# Altium project old.PrjPcb
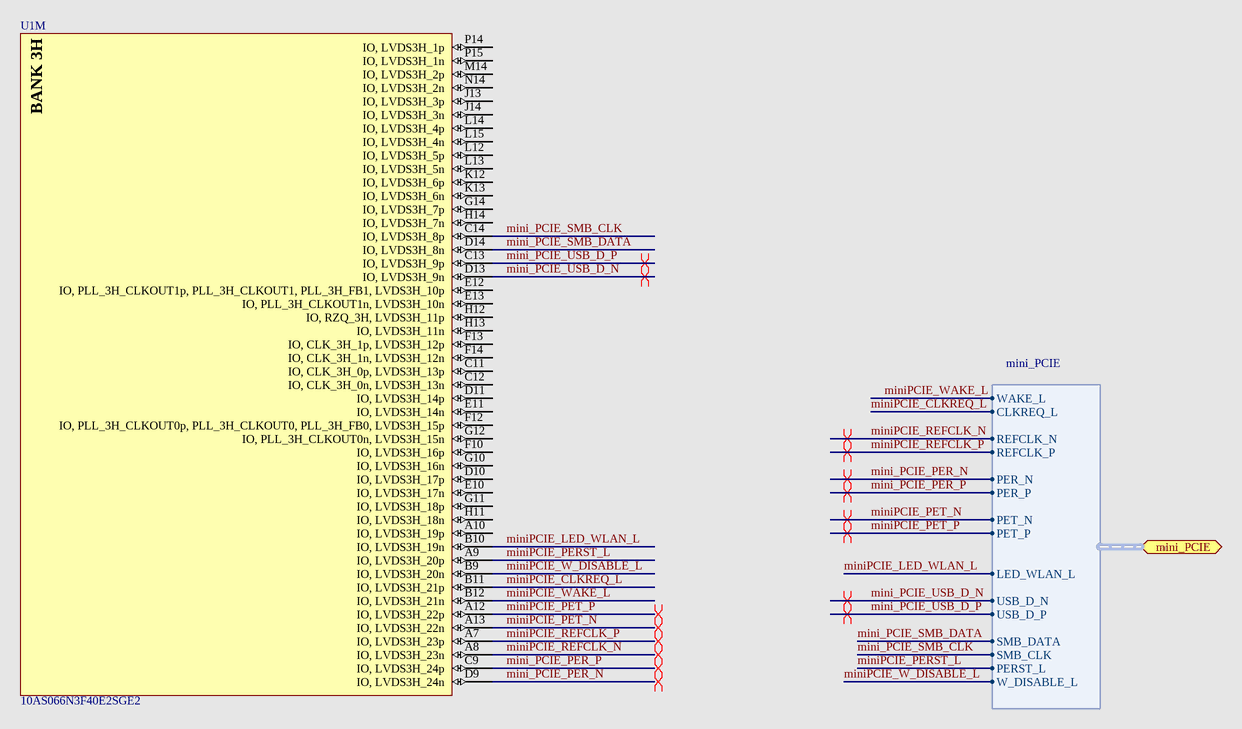
[diagram p0: old_Power.SchDoc]
5 sheets, 23 parts. Net scope: flat (ports and power ports of the same name join across sheets).
Sheets:
  old_Power.SchDoc
  old_Analog.SchDoc
  old_IO.SchDoc
  old_Debug.SchDoc
  old_Storage.SchDoc

## Sheet old_Power.SchDoc: miniPCIE Arria10
size B; DocumentNumber: 23; SheetNumber: 23; SheetTotal: 46

### Parts
(Parts that share a designator on the sheet are numbered #1, #2 ... from top to bottom, then left to right.)
U1#1  10AS066N3F40E2SGE2  [ALTR-FBGA1517_A-350]  (part M of 31)

### Ports
mini_PCIE (harness mini_PCIE)

### Harnesses
mini_PCIE: WAKE_L, CLKREQ_L, REFCLK_N, REFCLK_P, PER_N, PER_P, PET_N, PET_P, LED_WLAN_L, USB_D_N, USB_D_P, SMB_DATA, SMB_CLK, PERST_L, W_DISABLE_L

### Nets
mini_PCIE_PER_N: U1#1.D9(IO,_LVDS3H_24n) ; port mini_PCIE.PER_N
mini_PCIE_PER_P: U1#1.C9(IO,_LVDS3H_24p) ; port mini_PCIE.PER_P
mini_PCIE_SMB_CLK: U1#1.C14(IO,_LVDS3H_8p) ; port mini_PCIE.SMB_CLK
mini_PCIE_SMB_DATA: U1#1.D14(IO,_LVDS3H_8n) ; port mini_PCIE.SMB_DATA
mini_PCIE_USB_D_N: U1#1.D13(IO,_LVDS3H_9n) ; port mini_PCIE.USB_D_N
mini_PCIE_USB_D_P: U1#1.C13(IO,_LVDS3H_9p) ; port mini_PCIE.USB_D_P
miniPCIE_CLKREQ_L: U1#1.B11(IO,_LVDS3H_21p) ; port mini_PCIE.CLKREQ_L
miniPCIE_LED_WLAN_L: U1#1.B10(IO,_LVDS3H_19n) ; port mini_PCIE.LED_WLAN_L
miniPCIE_PERST_L: U1#1.A9(IO,_LVDS3H_20p) ; port mini_PCIE.PERST_L
miniPCIE_PET_N: U1#1.A13(IO,_LVDS3H_22n) ; port mini_PCIE.PET_N
miniPCIE_PET_P: U1#1.A12(IO,_LVDS3H_22p) ; port mini_PCIE.PET_P
miniPCIE_REFCLK_N: U1#1.A8(IO,_LVDS3H_23n) ; port mini_PCIE.REFCLK_N
miniPCIE_REFCLK_P: U1#1.A7(IO,_LVDS3H_23p) ; port mini_PCIE.REFCLK_P
miniPCIE_W_DISABLE_L: U1#1.B9(IO,_LVDS3H_20n) ; port mini_PCIE.W_DISABLE_L
miniPCIE_WAKE_L: U1#1.B12(IO,_LVDS3H_21n) ; port mini_PCIE.WAKE_L

Not connected (* = marked no-connect by the designer): U1#1 A10(IO,_LVDS3H_19p) C11(IO,_CLK_3H_0p,_LVDS3H_13p) C12(IO,_CLK_3H_0n,_LVDS3H_13n) D10(IO,_LVDS3H_17p) D11(IO,_LVDS3H_14p) E10(IO,_LVDS3H_17n) E11(IO,_LVDS3H_14n) E12(IO,_PLL_3H_CLKOUT1p,_PLL_3H_CLKOUT1,_PLL_3H_FB1,_LVDS3H_10p) E13(IO,_PLL_3H_CLKOUT1n,_LVDS3H_10n) F10(IO,_LVDS3H_16p) F12(IO,_PLL_3H_CLKOUT0p,_PLL_3H_CLKOUT0,_PLL_3H_FB0,_LVDS3H_15p) F13(IO,_CLK_3H_1p,_LVDS3H_12p) F14(IO,_CLK_3H_1n,_LVDS3H_12n) G10(IO,_LVDS3H_16n) G11(IO,_LVDS3H_18p) G12(IO,_PLL_3H_CLKOUT0n,_LVDS3H_15n) G14(IO,_LVDS3H_7p) H11(IO,_LVDS3H_18n) H12(IO,_RZQ_3H,_LVDS3H_11p) H13(IO,_LVDS3H_11n) H14(IO,_LVDS3H_7n) J13(IO,_LVDS3H_3p) J14(IO,_LVDS3H_3n) K12(IO,_LVDS3H_6p) K13(IO,_LVDS3H_6n) L12(IO,_LVDS3H_5p) L13(IO,_LVDS3H_5n) L14(IO,_LVDS3H_4p) L15(IO,_LVDS3H_4n) M14(IO,_LVDS3H_2p) N14(IO,_LVDS3H_2n) P14(IO,_LVDS3H_1p) P15(IO,_LVDS3H_1n)

### Layout directives
differential pair: mini_PCIE_PER_N, mini_PCIE_PER_P, mini_PCIE_USB_D_N, mini_PCIE_USB_D_P, miniPCIE_PET_N, miniPCIE_PET_P, miniPCIE_REFCLK_N, miniPCIE_REFCLK_P

### Notes on the sheet
- Title
- Size:
- Date:
- B
- Number:
- Time:
- Revision:
- Sheet
- of
- File:
- (in symbol CMP-1689-00006-3, part M) BANK 3H

### Library data of the parts
U1#1 = CMP-1689-00006-3: Arria 10 SX Family, 588 I/O Pins, 16 Fractional PLLs, 1517-Pin FBGA, Speed Grade 2, Extended Grade, RoHS; ComponentLink3Description: Package Specification; PackageVersion: Rev. 5.0, 01/2016; ComponentLink3URL: https://www.altera.com/content/dam/altera-www/global/en_US/pdfs/literature/packaging/04r00461-04.pdf; ComponentLink2Description: Datasheet; Code_JEDEC: MS-034; Mounting Technology: Surface Mount; PartNumber: 10AS066N3F40E2SGE2; PackageDescription: 1517-Pin FineLine Ball-Grid Array (FBGA), Body 40 x 40 mm, Pitch 1 mm; ComponentLink2URL: https://www.altera.com/content/dam/altera-www/global/en_US/pdfs/literature/hb/arria-10/a10_datasheet.pdf; ComponentLink1URL: https://www.altera.com/; DatasheetVersion: Rev. 2016-06-24, 06/2016; ComponentLink1Description: Manufacturer URL

## Sheet old_Analog.SchDoc
size A4; SheetNumber: 1; SheetTotal: 1; SPICEModelCacheCSPBSJPQ: <root> / <DocumentId>CSPBSJPQ</DocumentId> / <CacheFrame Number="0"> / <Model Name="bc846" Kind="MDL"> / <Text>.MODEL BC846 NPN(  BF=324.4 BR=8.29 CJC=3.347E-12 CJE=1.244E-11 FC=0.979 IKF=0.109 IKR=0.09 IRB=5E-06 IS=1.822E-14 ISC=9.982E-12 ISE=2.894E-16 ITF=0.3131 MJC=0.391 MJE=0.3656 MJS=0.333 NC=1.763 NE=1.4 NF=0.9932 NK=500M NR=0.9931 RB=10 RBM=5 RC=0.7014 RE=0.649 TF=4.908E-10 TR=9E-08 VAF=82 VAR=17.9 VJC=0.5463 VJE=0.7579 VTF=2.927 XCJC=0.6193 XTF=9.51 )</Text> / </Model> / </CacheFrame> / </root>
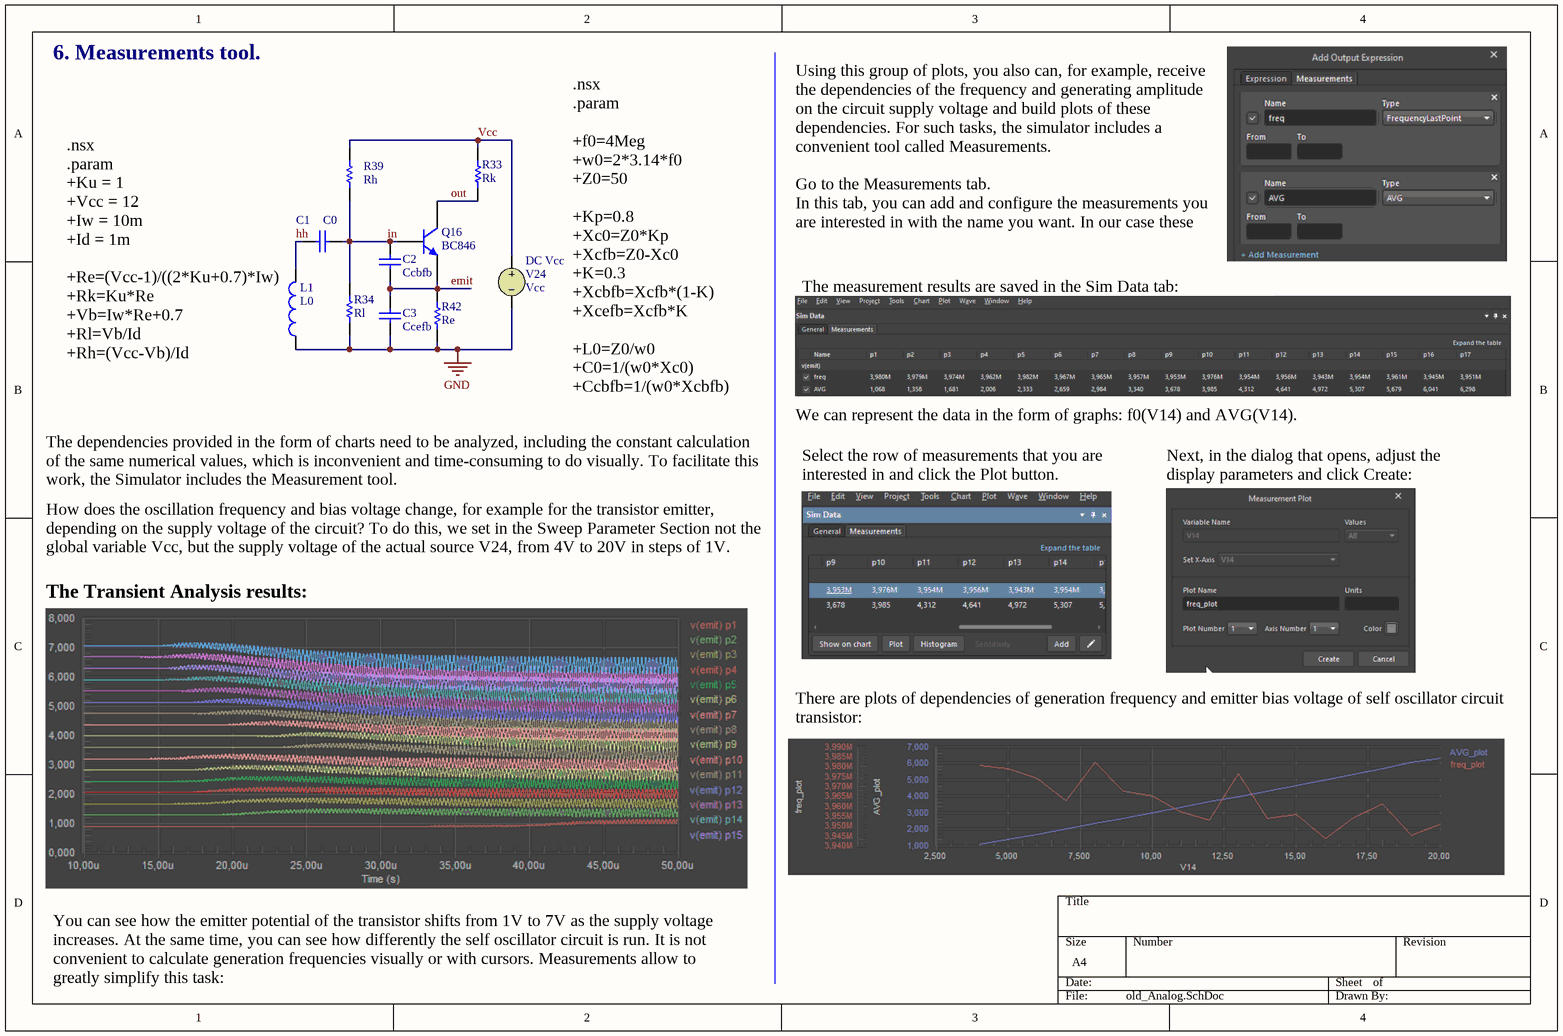
[diagram p1: old_Analog.SchDoc]

### Parts
C1  value C0  (hidden comment: Capacitor)
C2  value Ccbfb  (hidden comment: Capacitor)
C3  value Ccefb  (hidden comment: Capacitor)
L1  value L0  (hidden comment: Inductor)
Q16  BC846  [TO-92A]
R33  value Rk  (hidden comment: Resistor)
R34  value Rl  (hidden comment: Resistor)
R39  value Rh  (hidden comment: Resistor)
R42  value Re  (hidden comment: Resistor)
V24  DC Vcc  value Vcc

### Nets
GND: C3.1 L1.1 R34.2 R42.1 V24.2
emit: C2.1 C3.2 Q16.1(E) R42.2
hh: C1.1 L1.2
in: C1.2 C2.2 Q16.2(B) R34.1 R39.1
out: Q16.3(C) R33.1
Vcc: R33.2 R39.2 V24.1

### Notes on the sheet
- 6. Measurements tool.
- Using this group of plots, you also can, for example, receive the dependencies of the frequency and generating amplitude on the circuit supply voltage and build plots of these dependencies. For such tasks, the simulator includes a convenient tool called Measurements.
  Go to the Measurements tab.
  In this tab, you can add and configure the measurements you are interested in with the name you want. In our case these are: FrequenciLastPoint and AVG:
- The measurement results are saved in the Sim Data tab:
- (near L1) .nsx
  .param
  +Ku = 1
  +Vcc = 12
  +Iw = 10m
  +Id = 1m
  +Re=(Vcc-1)/((2*Ku+0.7)*Iw)
  +Rk=Ku*Re
  +Vb=Iw*Re+0.7
  +Rl=Vb/Id
  +Rh=(Vcc-Vb)/Id
- .nsx
  .param
  +f0=4Meg
  +w0=2*3.14*f0
  +Z0=50
  +Kp=0.8
  +Xc0=Z0*Kp
  +Xcfb=Z0-Xc0
  +K=0.3
  +Xcbfb=Xcfb*(1-K)
  +Xcefb=Xcfb*K
  +L0=Z0/w0
  +C0=1/(w0*Xc0)
  +Ccbfb=1/(w0*Xcbfb)
  +Ccefb=1/(w0*Xcefb)
- We can represent the data in the form of graphs: f0(V14) and AVG(V14).
- The dependencies provided in the form of charts need to be analyzed, including the constant calculation of the same numerical values, which is inconvenient and time-consuming to do visually. To facilitate this work, the Simulator includes the Measurement tool.
- Select the row of measurements that you are interested in and click the Plot button.
- Next, in the dialog that opens, adjust the display parameters and click Create:
- How does the oscillation frequency and bias voltage change, for example for the transistor emitter, depending on the supply voltage of the circuit? To do this, we set in the Sweep Parameter Section not the global variable Vcc, but the supply voltage of the actual source V24, from 4V to 20V in steps of 1V.
- The Transient Analysis results:
- There are plots of dependencies of generation frequency and emitter bias voltage of self oscillator circuit transistor:
- You can see how the emitter potential of the transistor shifts from 1V to 7V as the supply voltage increases. At the same time, you can see how differently the self oscillator circuit is run. It is not convenient to calculate generation frequencies visually or with cursors. Measurements allow to greatly simplify this task:

### Library data of the parts
C1-C3 = Capacitor: SimulationGenericComponent: True
L1 = Inductor: SimulationGenericComponent: True
Q16 = 2N3904: NPN General Purpose Amplifier; Published: 8-Jun-2000; LatestRevisionDate: 15-Jan-2003; LatestRevisionNote: PCB Footprint 'BCY-W3/D4.7' replaced; DatasheetVersion: 1997; PackageVersion: Sep-1998; PackageReference: TO-92A; Publisher: Altium Limited; PackageDescription: TO, Flat Index; 3 In-Line, Axial Leads; Body Dia. 4.5mm; Leads 0.51 x 0.48 mm (max); ComponentLink1Description: Manufacturer Link; ComponentLink1URL: http://www.fairchildsemi.com/; ComponentLink2Description: Datasheet; ComponentLink2URL: http://www.fairchildsemi.com/ds/2N%2F2N3904.pdf
V24 = VSRC: Voltage Source; Note: PCB Footprint - Not required; AC Magnitude: 0; Published: 30-July-2020; LatestRevisionDate: 30-July-2020; LatestRevisionNote: Re-released for DXP Platform.; PackageReference: Not Applicable; Publisher: Altium Limited

## Sheet old_IO.SchDoc: miniPCIE Connector
size B; DocumentNumber: 10; SheetNumber: 10; SheetTotal: 46
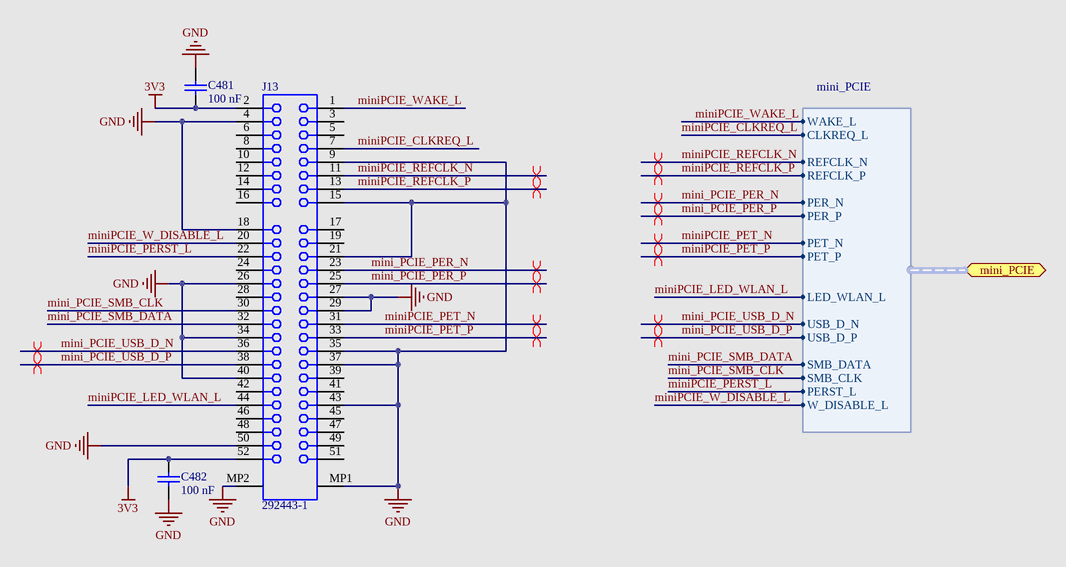
[diagram p2: old_IO.SchDoc]

### Parts
C481  Capacitance: 100 nF  [CAPC1005X55X10LL05]  (hidden comment: C1005X7R1E104M)
C482  Capacitance: 100 nF  [CAPC1005X55X10LL05]  (hidden comment: C1005X7R1E104M)
J13  292443-1  [BTB-SM0-8-2H52F]

### Ports
mini_PCIE (harness mini_PCIE)

### Harnesses
mini_PCIE: WAKE_L, CLKREQ_L, REFCLK_N, REFCLK_P, PER_N, PER_P, PET_N, PET_P, LED_WLAN_L, USB_D_N, USB_D_P, SMB_DATA, SMB_CLK, PERST_L, W_DISABLE_L

### Nets
3V3: C481.2 C482.1 J13.2 J13.52
GND: C481.1 C482.2 J13.4 J13.9 J13.15 J13.18 J13.21 J13.26 J13.27 J13.29 J13.34 J13.35 J13.37 J13.40 J13.43 J13.50 J13.MP1 J13.MP2
mini_PCIE_PER_N: J13.23 ; port mini_PCIE.PER_N
mini_PCIE_PER_P: J13.25 ; port mini_PCIE.PER_P
mini_PCIE_SMB_CLK: J13.30 ; port mini_PCIE.SMB_CLK
mini_PCIE_SMB_DATA: J13.32 ; port mini_PCIE.SMB_DATA
mini_PCIE_USB_D_N: J13.36 ; port mini_PCIE.USB_D_N
mini_PCIE_USB_D_P: J13.38 ; port mini_PCIE.USB_D_P
miniPCIE_CLKREQ_L: J13.7 ; port mini_PCIE.CLKREQ_L
miniPCIE_LED_WLAN_L: J13.44 ; port mini_PCIE.LED_WLAN_L
miniPCIE_PERST_L: J13.22 ; port mini_PCIE.PERST_L
miniPCIE_PET_N: J13.31 ; port mini_PCIE.PET_N
miniPCIE_PET_P: J13.33 ; port mini_PCIE.PET_P
miniPCIE_REFCLK_N: J13.11 ; port mini_PCIE.REFCLK_N
miniPCIE_REFCLK_P: J13.13 ; port mini_PCIE.REFCLK_P
miniPCIE_W_DISABLE_L: J13.20 ; port mini_PCIE.W_DISABLE_L
miniPCIE_WAKE_L: J13.1 ; port mini_PCIE.WAKE_L

Not connected (* = marked no-connect by the designer): J13 3 5 6 8 10 12 14 16 17 19 24 28 39 41 42 45 46 47 48 49 51

### Layout directives
differential pair: mini_PCIE_PER_N, mini_PCIE_PER_P, mini_PCIE_USB_D_N, mini_PCIE_USB_D_P, miniPCIE_PET_N, miniPCIE_PET_P, miniPCIE_REFCLK_N, miniPCIE_REFCLK_P

### Notes on the sheet
- Title
- Size:
- Date:
- B
- Number:
- Time:
- Revision:
- Sheet
- of
- File:

### Library data of the parts
C481 C482 = CMP-1663-00009-2: Chip Capacitor, 0.1 uF, +/- 20%, 25 V, -55 to 125 degC, 0402 (1005 Metric), RoHS, Tape and Reel; Type (Capacitors): X7R; Voltage Rating: 25 V; Case\/Package: 0402; Tolerance: 20%; Mounting Technology: Surface Mount; Max Operating Temperature: 125 degC; ComponentLink2URL: http://www.farnell.com/datasheets/1571323.pdf; ComponentLink1URL: http://www.tdk.com/; RoHSCompliant: true; Packaging: Tape and Reel; ComponentLink2Description: Datasheet; Case Code (Imperial): 0402; DatasheetVersion: 09/2011; ComponentLink1Description: Manufacturer URL; PackageDescription: 2-Pin Surface Mount Device, Body 1 x 0.5 mm; PackageReference: 0402; Min Operating Temperature: -55 degC; Case Code (Metric): 1005; Height: 0.5 mm; Package Quantity: 10000; Width: 0.5 mm; Pins: 2; Voltage Rating (DC): 25 V; PartNumber: C1005X7R1E104M; Mount: Surface Mount; Length: 1 mm
J13 = CMP-0001-00120-2: Board-to-Board Connector, SMT, Right Angle, Pitch 0.8mm, 52-Position, Female; Mating Connector: PCIeMini-CN-2S-M-R52; Publisher: Altium; Package Reference: BTB-SM0-8-2H52F; Datasheet Version: Oct-2006; ClassName: Board Template Connector; Component Kind: Standard; System: Connector

## Sheet old_Debug.SchDoc
size A4; SheetNumber: 1; SheetTotal: 1; SPICEModelCacheCSPBSJPQ: <root> / <DocumentId>CSPBSJPQ</DocumentId> / </root>
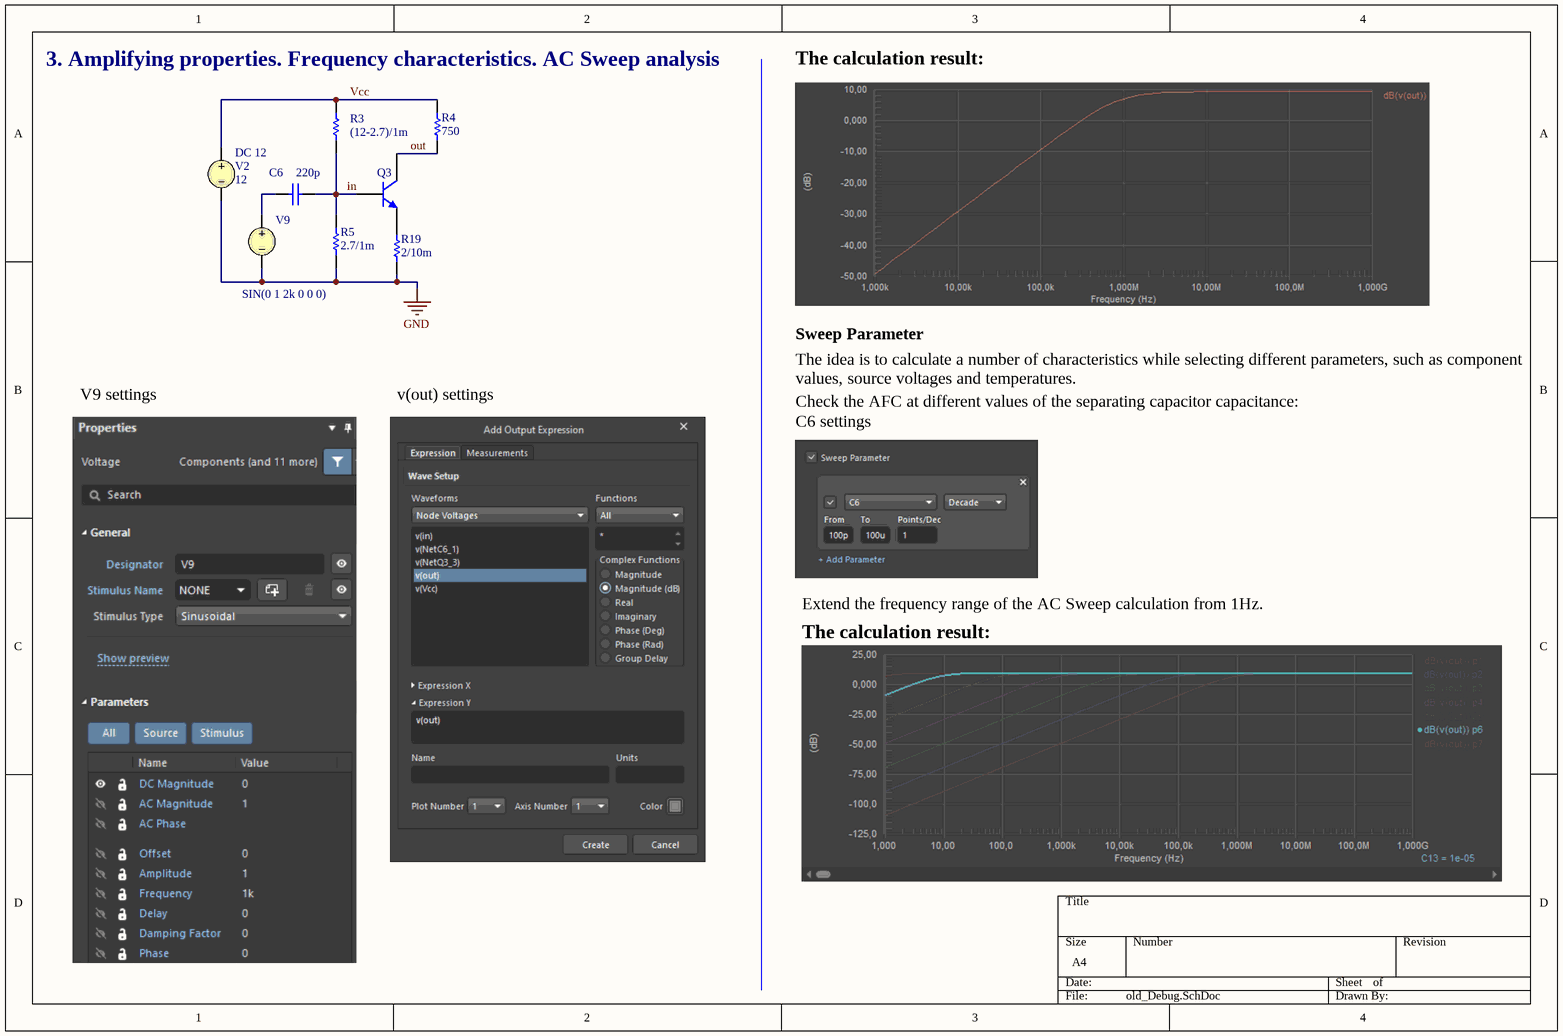
[diagram p3: old_Debug.SchDoc]

### Parts
C6  value 220p  (hidden comment: Capacitor)
Q3  Bipolar  NPN 3 Pins  Transistor  Modified Version of the Gummel-Poon Model  (value not drawn)
R3  value (12-2.7)/1m  (hidden comment: Resistor)
R4  value 750  (hidden comment: Resistor)
R5  value 2.7/1m  (hidden comment: Resistor)
R19  value 2/10m  (hidden comment: Resistor)
V2  DC 12  value 12
V9  SIN(0 1 2k 0 0 0)

### Nets
GND: R5.2 R19.1 V2.2 V9.2
in: C6.2 Q3.2(B) R3.1 R5.1
out: Q3.1(C) R4.1
Vcc: R3.2 R4.2 V2.1
NetC6_1: C6.1 V9.1
NetQ3_3: Q3.3(E) R19.2

### Notes on the sheet
- 3. Amplifying properties. Frequency characteristics. AC Sweep analysis
- The calculation result:
- The idea is to calculate a number of characteristics while selecting different parameters, such as component values, source voltages and temperatures.
- Sweep Parameter
- V9 settings
- v(out) settings
- Check the AFC at different values of the separating capacitor capacitance:
- C6 settings
- Extend the frequency range of the AC Sweep calculation from 1Hz.

### Library data of the parts
C6 = Capacitor: SimulationGenericComponent: True
Q3 = BJT NPN_MGP: BF: 100; AF: 0; BR: 1; EG: 1.11; FC: 0.5; IS: 1e-16; MJC: 0.33; NC: 2; NE: 1.5; TNOM: 27; VBC_MAX: 1e99; VJC: 0.75; XTI: 3; SimulationGenericComponent: True; CJC: 0; CJE: 0; CJS: 0; CTC: 0; CTE: 0; CTS: 0; IKF: 0; IKR: 0; IRB: 0; ISC: 0; ISE: 0; ISS: 0; ITF: 0; KF: 0; MJE: 0.33; MJS: 0; NF: 1; NKF: 0.5; NR: 1; NS: 1; PTF: 0; RB: 0; RBM: 0; RC: 0; RE: 0; SUBS: 1; TBF1: 0; TBF2: 0; TBR1: 0; TBR2: 0; TF: 0; TIKF1: 0; TIKF2: 0; TIKR1: 0; TIKR2: 0; TIRB1: 0; TIRB2: 0; TIS1: 0; TIS2: 0; TISC1: 0; TISC2: 0; TISE1: 0; TISE2: 0; TITF1: 0; TITF2: 0; TLEV: 0; TLEVC: 0; TMJC1: 0; TMJC2: 0; TMJE1: 0; TMJE2: 0; TMJS1: 0; TMJS2: 0; TNC1: 0; TNC2: 0; TNE1: 0; TNE2: 0; TNF1: 0; TNF2: 0; TNR1: 0; TNR2: 0; TNS1: 0; TNS2: 0; TR: 0; TRB1: 0; TRB2: 0; TRC1: 0; TRC2: 0; TRE1: 0; TRE2: 0; TRM1: 0; TRM2: 0; TTF1: 0; TTF2: 0; TTR1: 0; TTR2: 0; TVAF1: 0; TVAF2: 0; TVAR1: 0; TVAR2: 0; TVJC: 0; TVJE: 0; TVJS: 0; VAF: 0; VAR: 0; VBE_MAX: 1e99; VCE_MAX: 1e99; VJE: 0.75; VJS: 0.75; VTF: 0; XCJC: 1; XTB: 0; XTF: 0
V2 = VSRC: as V24 on sheet old_Analog; Published: 30-July-2020; LatestRevisionDate: 30-July-2020; LatestRevisionNote: Re-released for DXP Platform.; PackageReference: Not Applicable; Publisher: Altium Limited
V9 = VSRC: Voltage Source; Note: PCB Footprint - Not required; DC Magnitude: 0; AC Magnitude: 1; Frequency: 1k; Published: 30-July-2020; LatestRevisionDate: 30-July-2020; LatestRevisionNote: Re-released for DXP Platform.; PackageReference: Not Applicable; Publisher: Altium Limited; Offset: 0; Amplitude: 1; Delay: 0; Damping Factor: 0; Phase: 0

## Sheet old_Storage.SchDoc: miniPCIE Arria10
size B; DocumentNumber: 23; SheetNumber: 23; SheetTotal: 46
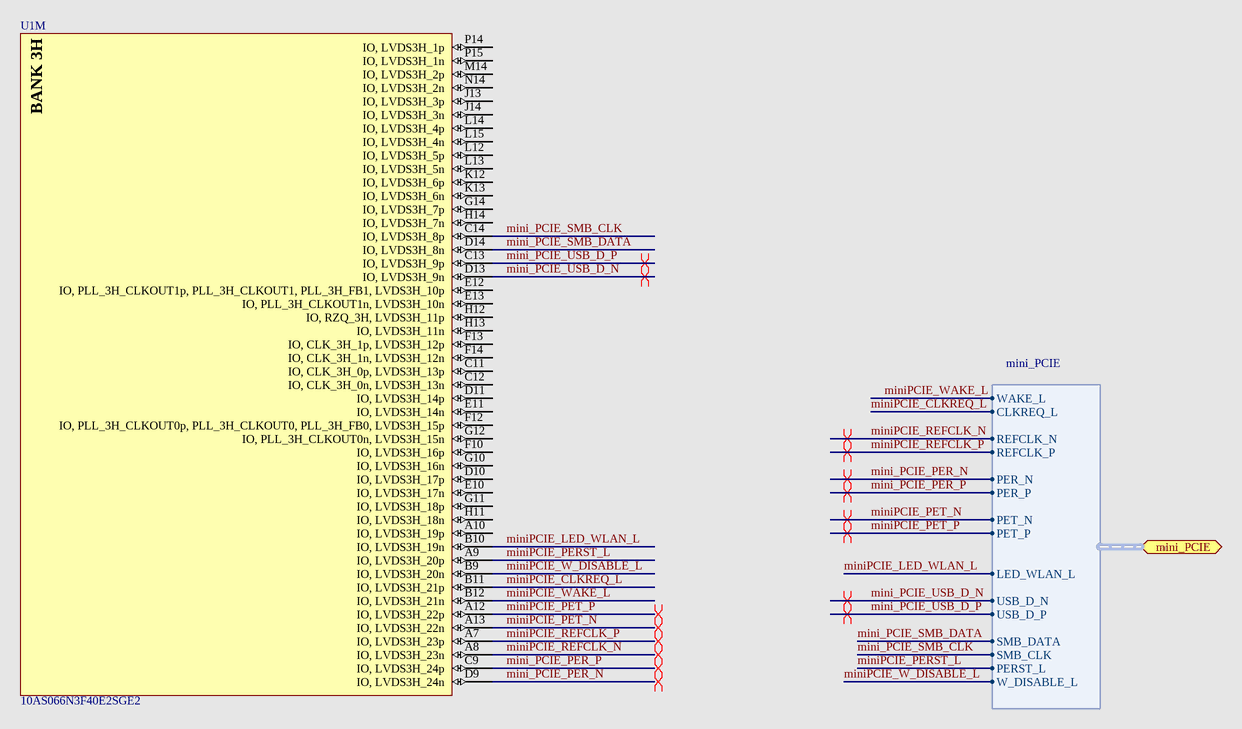
[diagram p4: old_Storage.SchDoc]

### Parts
(Parts that share a designator on the sheet are numbered #1, #2 ... from top to bottom, then left to right.)
U1#2  10AS066N3F40E2SGE2  [ALTR-FBGA1517_A-350]  (part M of 31)

### Ports
mini_PCIE (harness mini_PCIE)

### Harnesses
mini_PCIE: WAKE_L, CLKREQ_L, REFCLK_N, REFCLK_P, PER_N, PER_P, PET_N, PET_P, LED_WLAN_L, USB_D_N, USB_D_P, SMB_DATA, SMB_CLK, PERST_L, W_DISABLE_L

### Nets
mini_PCIE_PER_N: U1#2.D9(IO,_LVDS3H_24n) ; port mini_PCIE.PER_N
mini_PCIE_PER_P: U1#2.C9(IO,_LVDS3H_24p) ; port mini_PCIE.PER_P
mini_PCIE_SMB_CLK: U1#2.C14(IO,_LVDS3H_8p) ; port mini_PCIE.SMB_CLK
mini_PCIE_SMB_DATA: U1#2.D14(IO,_LVDS3H_8n) ; port mini_PCIE.SMB_DATA
mini_PCIE_USB_D_N: U1#2.D13(IO,_LVDS3H_9n) ; port mini_PCIE.USB_D_N
mini_PCIE_USB_D_P: U1#2.C13(IO,_LVDS3H_9p) ; port mini_PCIE.USB_D_P
miniPCIE_CLKREQ_L: U1#2.B11(IO,_LVDS3H_21p) ; port mini_PCIE.CLKREQ_L
miniPCIE_LED_WLAN_L: U1#2.B10(IO,_LVDS3H_19n) ; port mini_PCIE.LED_WLAN_L
miniPCIE_PERST_L: U1#2.A9(IO,_LVDS3H_20p) ; port mini_PCIE.PERST_L
miniPCIE_PET_N: U1#2.A13(IO,_LVDS3H_22n) ; port mini_PCIE.PET_N
miniPCIE_PET_P: U1#2.A12(IO,_LVDS3H_22p) ; port mini_PCIE.PET_P
miniPCIE_REFCLK_N: U1#2.A8(IO,_LVDS3H_23n) ; port mini_PCIE.REFCLK_N
miniPCIE_REFCLK_P: U1#2.A7(IO,_LVDS3H_23p) ; port mini_PCIE.REFCLK_P
miniPCIE_W_DISABLE_L: U1#2.B9(IO,_LVDS3H_20n) ; port mini_PCIE.W_DISABLE_L
miniPCIE_WAKE_L: U1#2.B12(IO,_LVDS3H_21n) ; port mini_PCIE.WAKE_L

Not connected (* = marked no-connect by the designer): U1#2 A10(IO,_LVDS3H_19p) C11(IO,_CLK_3H_0p,_LVDS3H_13p) C12(IO,_CLK_3H_0n,_LVDS3H_13n) D10(IO,_LVDS3H_17p) D11(IO,_LVDS3H_14p) E10(IO,_LVDS3H_17n) E11(IO,_LVDS3H_14n) E12(IO,_PLL_3H_CLKOUT1p,_PLL_3H_CLKOUT1,_PLL_3H_FB1,_LVDS3H_10p) E13(IO,_PLL_3H_CLKOUT1n,_LVDS3H_10n) F10(IO,_LVDS3H_16p) F12(IO,_PLL_3H_CLKOUT0p,_PLL_3H_CLKOUT0,_PLL_3H_FB0,_LVDS3H_15p) F13(IO,_CLK_3H_1p,_LVDS3H_12p) F14(IO,_CLK_3H_1n,_LVDS3H_12n) G10(IO,_LVDS3H_16n) G11(IO,_LVDS3H_18p) G12(IO,_PLL_3H_CLKOUT0n,_LVDS3H_15n) G14(IO,_LVDS3H_7p) H11(IO,_LVDS3H_18n) H12(IO,_RZQ_3H,_LVDS3H_11p) H13(IO,_LVDS3H_11n) H14(IO,_LVDS3H_7n) J13(IO,_LVDS3H_3p) J14(IO,_LVDS3H_3n) K12(IO,_LVDS3H_6p) K13(IO,_LVDS3H_6n) L12(IO,_LVDS3H_5p) L13(IO,_LVDS3H_5n) L14(IO,_LVDS3H_4p) L15(IO,_LVDS3H_4n) M14(IO,_LVDS3H_2p) N14(IO,_LVDS3H_2n) P14(IO,_LVDS3H_1p) P15(IO,_LVDS3H_1n)

### Layout directives
differential pair: mini_PCIE_PER_N, mini_PCIE_PER_P, mini_PCIE_USB_D_N, mini_PCIE_USB_D_P, miniPCIE_PET_N, miniPCIE_PET_P, miniPCIE_REFCLK_N, miniPCIE_REFCLK_P

### Notes on the sheet
- Title
- Size:
- Date:
- B
- Number:
- Time:
- Revision:
- Sheet
- of
- File:
- (in symbol CMP-1689-00006-3, part M) BANK 3H

### Library data of the parts
U1#2 = CMP-1689-00006-3: as U1#1 on sheet old_Power; ComponentLink3Description: Package Specification; PackageVersion: Rev. 5.0, 01/2016; ComponentLink3URL: https://www.altera.com/content/dam/altera-www/global/en_US/pdfs/literature/packaging/04r00461-04.pdf; ComponentLink2Description: Datasheet; Code_JEDEC: MS-034; Mounting Technology: Surface Mount; PartNumber: 10AS066N3F40E2SGE2; PackageDescription: 1517-Pin FineLine Ball-Grid Array (FBGA), Body 40 x 40 mm, Pitch 1 mm; ComponentLink2URL: https://www.altera.com/content/dam/altera-www/global/en_US/pdfs/literature/hb/arria-10/a10_datasheet.pdf; ComponentLink1URL: https://www.altera.com/; DatasheetVersion: Rev. 2016-06-24, 06/2016; ComponentLink1Description: Manufacturer URL

## Nets that join several sheets
GND: old_Analog (5 pins), old_IO (18 pins), old_Debug (R5.2 R19.1 V2.2 V9.2)
mini_PCIE_PER_N: old_Power (U1#1.D9), old_IO (J13.23), old_Storage (U1#2.D9)
mini_PCIE_PER_P: old_Power (U1#1.C9), old_IO (J13.25), old_Storage (U1#2.C9)
mini_PCIE_SMB_CLK: old_Power (U1#1.C14), old_IO (J13.30), old_Storage (U1#2.C14)
mini_PCIE_SMB_DATA: old_Power (U1#1.D14), old_IO (J13.32), old_Storage (U1#2.D14)
mini_PCIE_USB_D_N: old_Power (U1#1.D13), old_IO (J13.36), old_Storage (U1#2.D13)
mini_PCIE_USB_D_P: old_Power (U1#1.C13), old_IO (J13.38), old_Storage (U1#2.C13)
miniPCIE_CLKREQ_L: old_Power (U1#1.B11), old_IO (J13.7), old_Storage (U1#2.B11)
miniPCIE_LED_WLAN_L: old_Power (U1#1.B10), old_IO (J13.44), old_Storage (U1#2.B10)
miniPCIE_PERST_L: old_Power (U1#1.A9), old_IO (J13.22), old_Storage (U1#2.A9)
miniPCIE_PET_N: old_Power (U1#1.A13), old_IO (J13.31), old_Storage (U1#2.A13)
miniPCIE_PET_P: old_Power (U1#1.A12), old_IO (J13.33), old_Storage (U1#2.A12)
miniPCIE_REFCLK_N: old_Power (U1#1.A8), old_IO (J13.11), old_Storage (U1#2.A8)
miniPCIE_REFCLK_P: old_Power (U1#1.A7), old_IO (J13.13), old_Storage (U1#2.A7)
miniPCIE_W_DISABLE_L: old_Power (U1#1.B9), old_IO (J13.20), old_Storage (U1#2.B9)
miniPCIE_WAKE_L: old_Power (U1#1.B12), old_IO (J13.1), old_Storage (U1#2.B12)